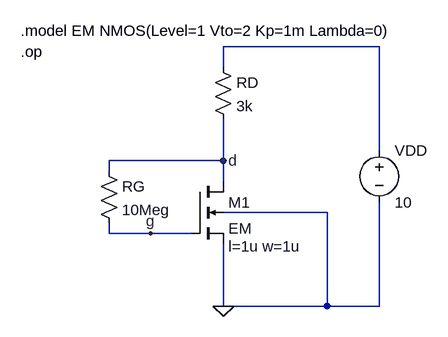
[diagram p0: schematic Ex07.asc]
Ex07.asc, the LTspice schematic file:
Version 4.1
SHEET 1 1200 800
WIRE 480 -112 240 -112
WIRE 240 -80 240 -112
WIRE 480 48 480 -112
WIRE 240 64 240 0
WIRE 240 64 64 64
WIRE 64 80 64 64
WIRE 240 96 240 64
WIRE 400 144 240 144
WIRE 64 176 64 160
WIRE 128 176 64 176
WIRE 192 176 128 176
WIRE 240 288 240 192
WIRE 400 288 400 144
WIRE 400 288 240 288
WIRE 480 288 480 128
WIRE 480 288 400 288
FLAG 240 288 0
FLAG 240 64 d
FLAG 128 176 g
SYMBOL nmos4 192 96 R0
WINDOW 39 56 100 Left 2
SYMATTR SpiceLine l=1u w=1u
SYMATTR InstName M1
SYMATTR Value EM
SYMBOL res 224 -96 R0
SYMATTR InstName RD
SYMATTR Value 3k
SYMBOL res 48 64 R0
SYMATTR InstName RG
SYMATTR Value 10Meg
SYMBOL voltage 480 32 R0
SYMATTR InstName VDD
SYMATTR Value 10
TEXT -72 -136 Left 2 !.model EM NMOS(Level=1 Vto=2 Kp=1m Lambda=0)
TEXT -72 -104 Left 2 !.op

The netlist it stands for:
* Ex07.asc
M1 d g 0 0 EM l=1u w=1u
RD N001 d 3k
RG d g 10Meg
VDD N001 0 10
.model NMOS NMOS
.model PMOS PMOS
.lib standard.mos
.model EM NMOS(Level=1 Vto=2 Kp=1m Lambda=0)
.op
.backanno
.end